# Altium project ESP32_Relay_Controller.PrjPcb
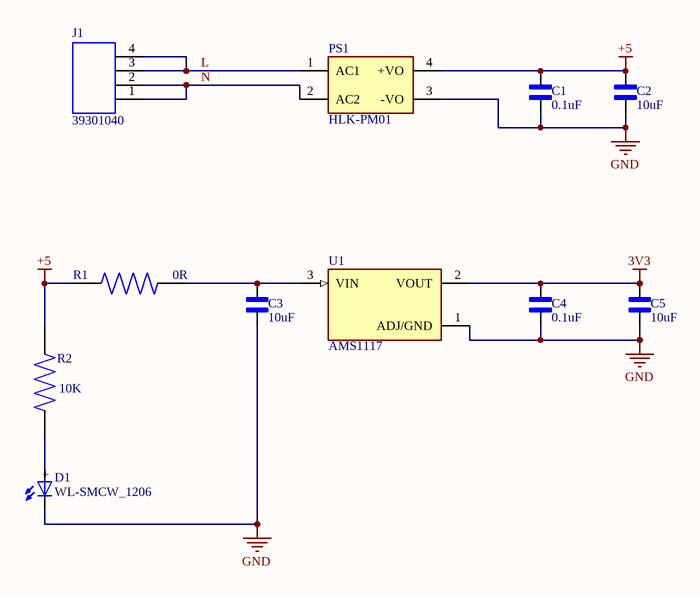
[diagram p0: Nguon.SchDoc]
2 sheets, 44 parts. Net scope: global (net labels, ports and power ports of the same name join across sheets).
Board file: PCB_esp32.PcbDoc
Sheets:
  Nguon.SchDoc
  vi_xu_ly.SchDoc

## Sheet Nguon.SchDoc
size A; SheetNumber: 1; SheetTotal: 3

### Parts
C1  0.1uF  [CAPC1608X94N]
C2  10uF  [CAPC1608X94N]
C3  10uF  [CAPC1608X94N]
C4  0.1uF  [CAPC1608X94N]
C5  10uF  [CAPC1608X94N]
D1  WL-SMCW_1206  [WL-SMCW_1206]
J1  39301040  [CONN_5569-04A_MOL]
PS1  HLK-PM01  [CONV_HLK-PM01]
R1  0R  [RES_ERJU03J474V]
R2  10K  [RES_ERJU03J474V]
U1  AMS1117  [SOT229P700X180-4N]

### Nets
3V3: C4.2 C5.2 U1.2(VOUT)
+5: C1.2 C2.2 PS1.4(+VO) R1.1 R2.1
GND: C1.1 C2.1 C3.1 C4.1 C5.1 D1.1(NEG) PS1.3(-VO) U1.1(ADJ/GND)
L: J1.3 J1.4 PS1.1(AC1)
N: J1.1 J1.2 PS1.2(AC2)
NetC3_2: C3.2 R1.2 U1.3(VIN)
NetD1_2: D1.2(POS) R2.2

### Notes on the sheet
- (in symbol WL-SMCW_1206) +

### Library data of the parts
C1-C5 = cap_0603_VJ0603D3R9DXCAP: cap 0603 (1608 Metric); MF: Vishay Vitramon; SnapEDA_Link: https://www.snapeda.com/parts/VJ0603D3R9DXCAP/Vishay/view-part/?ref=snap; Package: 1608 Vishay Vitramon; Value: *; MP: VJ0603D3R9DXCAP; Check_prices: https://www.snapeda.com/parts/VJ0603D3R9DXCAP/Vishay/view-part/?ref=eda
D1 = WL-SMCW_1206: 1206, Blue Typ.(@20mA): 470nm, 145mcd, 3.2V, 140Â° InGaN; MF: Wurth Electronics; MP: 150120BS75000; SnapEDA_Link: https://www.snapeda.com/parts/150120BS75000/Wurth+Electronics/view-part/?ref=snap; Package: 1206 Wurth Electronics; Value: *; Check_prices: https://www.snapeda.com/parts/150120BS75000/Wurth+Electronics/view-part/?ref=eda
J1 = 39301040: Conn Wire to Board HDR 4 POS 4.2mm Solder RA Side Entry Thru-Hole Mini-Fit Jrâ„¢ Bag; MF: Molex; SnapEDA_Link: https://www.snapeda.com/parts/39301040/Molex/view-part/?ref=snap; Package: None; Value: *; MP: 39301040; Check_prices: https://www.snapeda.com/parts/39301040/Molex/view-part/?ref=eda
PS1 = HLK-PM01: The HLK-PM01 is a small size low cost AC to DC converter which can take in 110V/220V AC at 50/60 Hz and give 5V 3W output. The module is can be used in designs which run on 5V and needs to be powered form the AC mains.; MF: Hi-link; SnapEDA_Link: https://www.snapeda.com/parts/hlk-pm01/Hi-link/view-part/?ref=snap; Package: None; Value: *; MP: hlk-pm01; Check_prices: https://www.snapeda.com/parts/hlk-pm01/Hi-link/view-part/?ref=eda
R1 R2 = res_0603_ERJU03J474V: 0603 Anti-Sulfurated; MF: Panasonic; SnapEDA_Link: https://www.snapeda.com/parts/ERJU03J474V/Panasonic/view-part/?ref=snap; Package: 1608-2 Panasonic; Value: *; MP: ERJU03J474V; Check_prices: https://www.snapeda.com/parts/ERJU03J474V/Panasonic/view-part/?ref=eda
U1 = AMS1117: 1A LOW DROPOUT VOLTAGE REGULATOR SOT-223; MF: Advanced Monolithic Systems; SnapEDA_Link: https://www.snapeda.com/parts/AMS1117/Advanced+Monolithic+Systems/view-part/?ref=snap; Package: SOT-223 Seeed Technology; Value: *; MP: AMS1117; Check_prices: https://www.snapeda.com/parts/AMS1117/Advanced+Monolithic+Systems/view-part/?ref=eda

## Sheet vi_xu_ly.SchDoc
size 381 x 241 mm; SheetNumber: 2; SheetTotal: 3
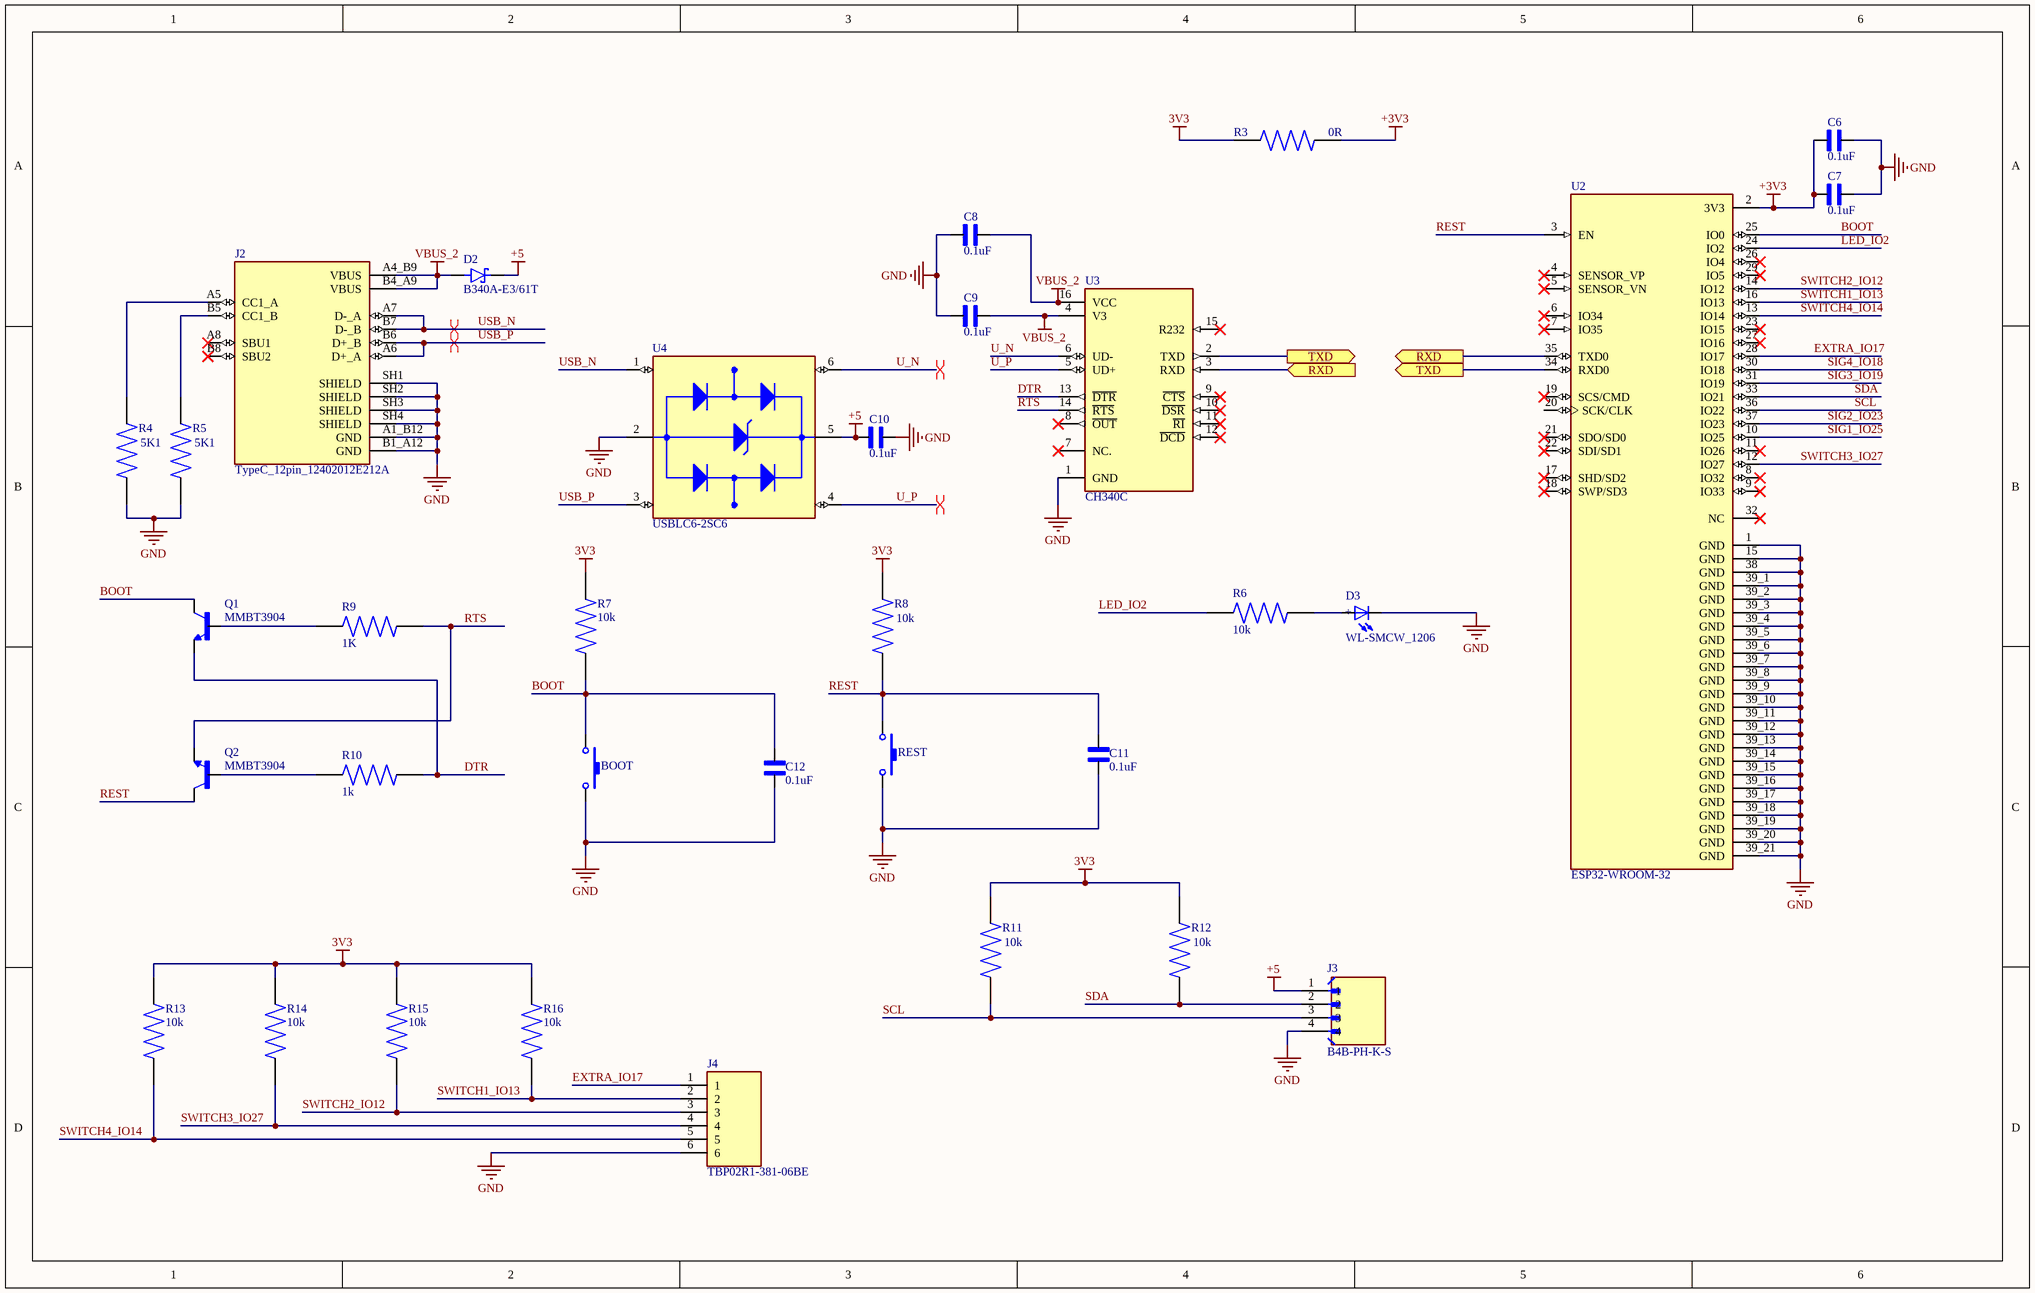
[diagram p1: vi_xu_ly.SchDoc]

### Parts
BOOT  Nut Nhan 2 Chan SMD 3x6x2.5  [PCBComponent_1]  (value not drawn)
C6  0.1uF  [CAPC1608X94N]
C7  0.1uF  [CAPC1608X94N]
C8  0.1uF  [CAPC1608X94N]
C9  0.1uF  [CAPC1608X94N]
C10  0.1uF  [CAPC1608X94N]
C11  0.1uF  [CAPC1608X94N]
C12  0.1uF  [CAPC1608X94N]
D2  B340A-E3/61T  [DIOM5126X229N]
D3  WL-SMCW_1206  [WL-SMCW_1206]
J2  TypeC_12pin_12402012E212A  [TypeC_12pin_12402012E212A]
J3  B4B-PH-K-S  [JST_B4B-PH-K-S]
J4  TBP02R1-381-06BE  [CUI_TBP02R1-381-06BE]
Q1  MMBT3904  [TRANS_MMBT3904]
Q2  MMBT3904  [TRANS_MMBT3904]
R3  0R  [RES_ERJU03J474V]
R4  5K1  [RES_ERJU03J474V]
R5  5K1  [RES_ERJU03J474V]
R6  10k  [RES_ERJU03J474V]
R7  10k  [RES_ERJU03J474V]
R8  10k  [RES_ERJU03J474V]
R9  1K  [RES_ERJU03J474V]
R10  1k  [RES_ERJU03J474V]
R11  10k  [RES_ERJU03J474V]
R12  10k  [RES_ERJU03J474V]
R13  10k  [RES_ERJU03J474V]
R14  10k  [RES_ERJU03J474V]
R15  10k  [RES_ERJU03J474V]
R16  10k  [RES_ERJU03J474V]
REST  Nut Nhan 2 Chan SMD 3x6x2.5  [PCBComponent_1]  (value not drawn)
U2  ESP32-WROOM-32  [MODULE_ESP32-WROOM-32]
U3  CH340C  [CH340C]
U4  USBLC6-2SC6  [USBLC6-2SC6]

### Ports
RXD (in), RXD (out), TXD (out)

### Nets
3V3: R3.1 R7.1 R8.1 R11.1 R12.1 R13.1 R14.1 R15.1 R16.1
+3V3: C6.2 C7.2 R3.2 U2.2(3V3)
+5: C10.1 D2.C J3.1 U4.5(VBUS)
GND: BOOT.2 C6.1 C7.1 C8.1 C9.1 C10.2 C11.2 C12.2 D3.1(NEG) J2.A1_B12(GND) J2.B1_A12(GND) J2.SH1(SHIELD) J2.SH2(SHIELD) J2.SH3(SHIELD) J2.SH4(SHIELD) J3.4 J4.6 R4.1 R5.1 REST.2 U2.1(GND) U2.15(GND) U2.38(GND) U2.39_1(GND) U2.39_2(GND) U2.39_3(GND) U2.39_4(GND) U2.39_5(GND) U2.39_6(GND) U2.39_7(GND) U2.39_8(GND) U2.39_9(GND) U2.39_10(GND) U2.39_11(GND) U2.39_12(GND) U2.39_13(GND) U2.39_14(GND) U2.39_15(GND) U2.39_16(GND) U2.39_17(GND) U2.39_18(GND) U2.39_19(GND) U2.39_20(GND) U2.39_21(GND) U3.1(GND) U4.2(GND)
VBUS_2: C8.2 C9.2 D2.A J2.A4_B9(VBUS) J2.B4_A9(VBUS) U3.4(V3) U3.16(VCC)
BOOT: BOOT.1 C12.1 Q1.3(C) R7.2 U2.25(IO0)
DTR: Q1.2(E) R10.2 U3.13(~{DTR})
EXTRA_IO17: J4.1 U2.28(IO17)
LED_IO2: R6.1 U2.24(IO2)
REST: C11.1 Q2.3(C) R8.2 REST.1 U2.3(EN)
RTS: Q2.2(E) R9.2 U3.14(~{RTS})
SCL: J3.3 R11.2 U2.36(IO22)
SDA: J3.2 R12.2 U2.33(IO21)
SIG1_IO25: U2.10(IO25)
SIG2_IO23: U2.37(IO23)
SIG3_IO19: U2.31(IO19)
SIG4_IO18: U2.30(IO18)
SWITCH1_IO13: J4.2 R16.2 U2.16(IO13)
SWITCH2_IO12: J4.3 R15.2 U2.14(IO12)
SWITCH3_IO27: J4.4 R14.2 U2.12(IO27)
SWITCH4_IO14: J4.5 R13.2 U2.13(IO14)
U_N: U3.6(UD-) U4.6(I/O1_OUT)
U_P: U3.5(UD+) U4.4(I/O2_OUT)
USB_N: J2.A7(D-_A) J2.B7(D-_B) U4.1(I/O1_IN)
USB_P: J2.A6(D+_A) J2.B6(D+_B) U4.3(I/O2_IN)
NetD3_2: D3.2(POS) R6.2
NetJ2_A5: J2.A5(CC1_A) R4.2
NetJ2_B5: J2.B5(CC1_B) R5.2
NetQ1_1: Q1.1(B) R9.1
NetQ2_1: Q2.1(B) R10.1
NetU2_34: U2.34(RXD0) U3.2(TXD) ; port TXD
NetU2_35: U2.35(TXD0) U3.3(RXD) ; port RXD

Not connected (* = marked no-connect by the designer): J2 A8(SBU1)* B8(SBU2)*; U2 4(SENSOR_VP)* 5(SENSOR_VN)* 6(IO34)* 7(IO35)* 8(IO32)* 9(IO33)* 11(IO26)* 17(SHD/SD2)* 18(SWP/SD3)* 19(SCS/CMD)* 20(SCK/CLK) 21(SDO/SD0)* 22(SDI/SD1)* 23(IO15)* 26(IO4)* 27(IO16)* 29(IO5)* 32(NC)*; U3 7(NC.)* 8(~{OUT})* 9(~{CTS})* 10(~{DSR})* 11(~{RI})* 12(~{DCD})* 15(R232)*

### Layout directives
differential pair: U_N, U_P, USB_N, USB_P

### Notes on the sheet
- (in symbol WL-SMCW_1206) +

### Library data of the parts
BOOT REST = Nut Nhan 2 Chan SMD 3x6x2.5: Ma_Hang: MH001036; Ten: Nút Nhấn 2 Chân 3x6x2.5MM SMD
C6-C12 = cap_0603_VJ0603D3R9DXCAP: as C1 on sheet Nguon; SnapEDA_Link: https://www.snapeda.com/parts/VJ0603D3R9DXCAP/Vishay/view-part/?ref=snap; Package: 1608 Vishay Vitramon; Value: *; MP: VJ0603D3R9DXCAP; Check_prices: https://www.snapeda.com/parts/VJ0603D3R9DXCAP/Vishay/view-part/?ref=eda
D2 = B340A-E3/61T: Diode Schottky 40 V 3A Surface Mount DO-214AC (SMA); MF: Vishay Semiconductor; SnapEDA_Link: https://www.snapeda.com/parts/B340A-E3/61T/Vishay/view-part/?ref=snap; Package: DO-214 Vishay Semiconductor; Value: *; MP: B340A-E3/61T; Check_prices: https://www.snapeda.com/parts/B340A-E3/61T/Vishay/view-part/?ref=eda
D3 = WL-SMCW_1206: 1206, Blue Typ.(@20mA): 470nm, 145mcd, 2.9V, 140Â° InGaN; MF: Wurth Electronics; MP: 150120BS75000; SnapEDA_Link: https://www.snapeda.com/parts/150120BS75000/Wurth+Electronics/view-part/?ref=snap; Package: 1206 Wurth Electronics; Value: *; Check_prices: https://www.snapeda.com/parts/150120BS75000/Wurth+Electronics/view-part/?ref=eda
J2 = TypeC_12pin_12402012E212A: USB2.0, Type C, Top mount, CH 1.68mm, Dual Row SMT; MF: Amphenol ICC (Commercial Products); MP: 12402012E212A; Price: None; Package: None; Availability: In Stock; SnapEDA_Link: https://www.snapeda.com/parts/12402012E212A/Amphenol/view-part/?ref=snap; Value: *; Check_prices: https://www.snapeda.com/parts/12402012E212A/Amphenol/view-part/?ref=eda; Purchase-URL: https://pricing.snapeda.com/search/part/12402012E212A/?ref=eda
J3 = B4B-PH-K-S: MF: {'manufacturer': u'JST Sales America Inc.'}; Package: None; Price: None; Value: *; MP: B4B-PH-K-S; Availability: Unavailable
J4 = TBP02R1-381-06BE: 2~24 Poles, Pluggable,Receptacle, Horizontal, 3.81 Pitch, Terminal Block Connector; MF: Same Sky; SnapEDA_Link: https://www.snapeda.com/parts/TBP02R1-381-06BE/Same+Sky/view-part/?ref=snap; Package: None; Value: *; MP: TBP02R1-381-06BE; Check_prices: https://www.snapeda.com/parts/TBP02R1-381-06BE/Same+Sky/view-part/?ref=eda
Q1 Q2 = MMBT3904: BJT, SOT-23, 40V, 200mA, NPN, 0.35W, 150Â°C; MF: Diotec Semiconductor; SnapEDA_Link: https://www.snapeda.com/parts/MMBT3904/Diotec/view-part/?ref=snap; Package: SOT-23 Diotec; Value: *; MP: MMBT3904; Check_prices: https://www.snapeda.com/parts/MMBT3904/Diotec/view-part/?ref=eda
R3-R16 = res_0603_ERJU03J474V: 0603 Anti-Sulfurated; MF: Panasonic; SnapEDA_Link: https://www.snapeda.com/parts/ERJU03J474V/Panasonic/view-part/?ref=snap; Package: 1608-2 Panasonic; Value: *; MP: ERJU03J474V; Check_prices: https://www.snapeda.com/parts/ERJU03J474V/Panasonic/view-part/?ref=eda
U2 = ESP32-WROOM-32: Bluetooth, WiFi 802.11b/g/n, Bluetooth v4.2 +EDR, Class 1, 2 and 3 Transceiver Module 2.4GHz ~ 2.5GHz Antenna Not Included, U.FL Surface Mount; MF: Espressif Systems; Price: None; Availability: In Stock; MP: ESP32-WROOM-32; Package: Module Espressif Systems; SnapEDA_Link: https://www.snapeda.com/parts/ESP32-WROOM-32/Espressif+Systems/view-part/?ref=snap; Check_prices: https://www.snapeda.com/parts/ESP32-WROOM-32/Espressif+Systems/view-part/?ref=eda; Value: *; Purchase-URL: https://pricing.snapeda.com/search/part/ESP32-WROOM-32/?ref=eda
U3 = CH340C: USB to serial chip CH340; MF: WCH; Price: None; Availability: Not in stock; MP: CH340C; Package: None; SnapEDA_Link: https://www.snapeda.com/parts/CH340C/WCH/view-part/?ref=snap; Check_prices: https://www.snapeda.com/parts/CH340C/WCH/view-part/?ref=eda; Value: *
U4 = USBLC6-2SC6: 17V Clamp 5A (8/20Âµs) Ipp Tvs Diode Surface Mount SOT-23-6; MF: STMicroelectronics; Value: *; SnapEDA_Link: https://www.snapeda.com/parts/USBLC6-2SC6/STMicroelectronics/view-part/?ref=snap; Check_prices: https://www.snapeda.com/parts/USBLC6-2SC6/STMicroelectronics/view-part/?ref=eda; Purchase-URL: https://pricing.snapeda.com/search/part/USBLC6-2SC6/?ref=eda; Price: None; Availability: In Stock; Package: SOT-23-6 STMicroelectronics; MP: USBLC6-2SC6

## Nets that join several sheets
3V3: Nguon (C4.2 C5.2 U1.2), vi_xu_ly (9 pins)
+5: Nguon (5 pins), vi_xu_ly (C10.1 D2.C J3.1 U4.5)
GND: Nguon (8 pins), vi_xu_ly (46 pins)